# EAGLE design ring_oled_v3-1-1 (EAGLE 9.6.2)
COMPANY: ADAFRUIT INDUSTRIES; DRAWN: KTOWN; REV: F
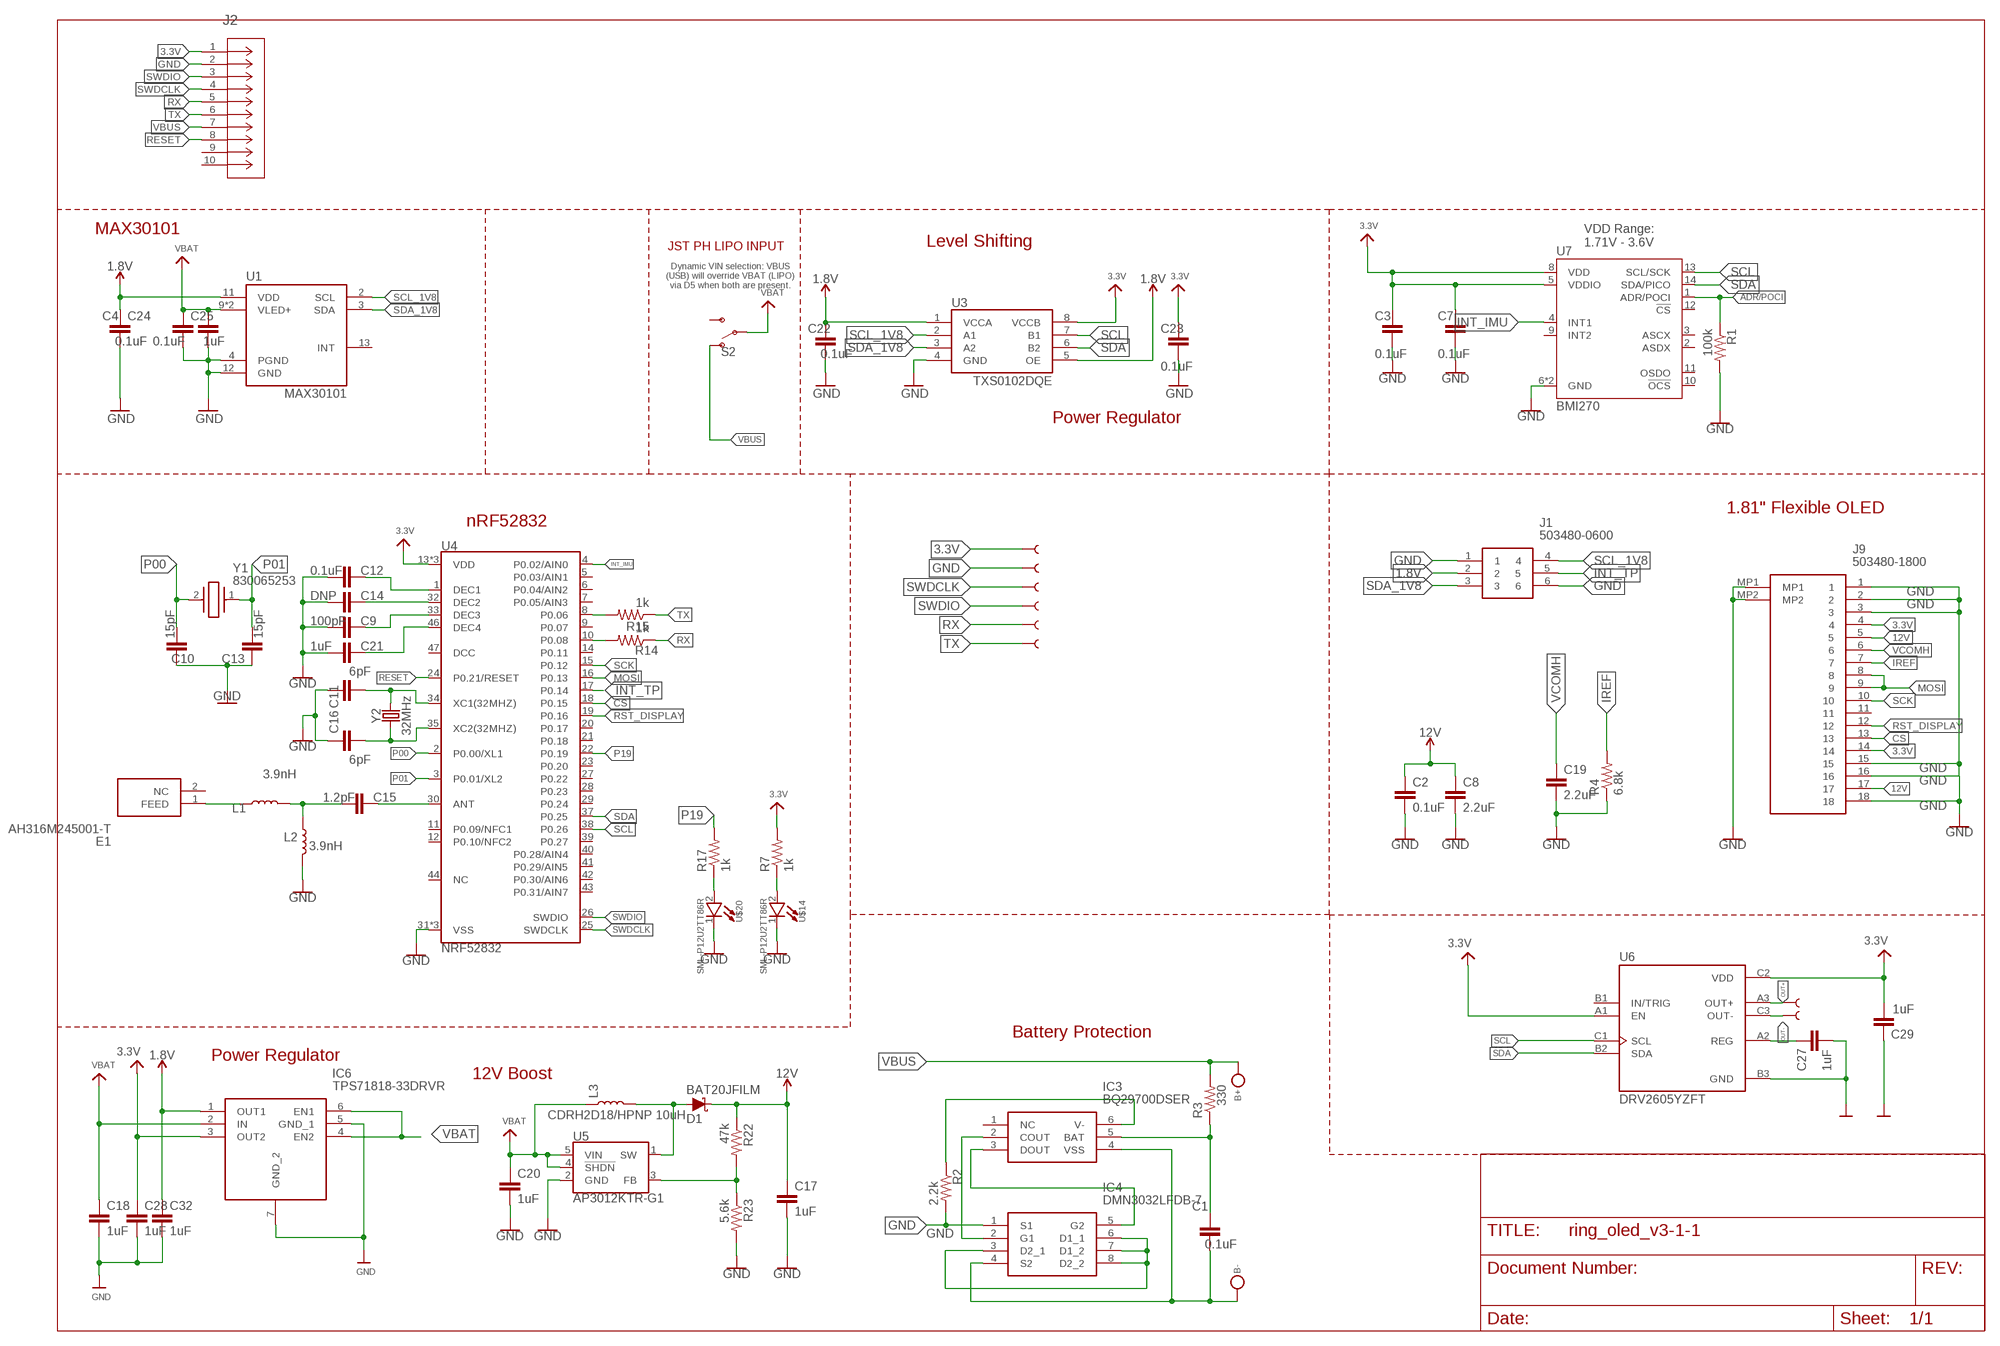
[diagram p0: schematic, sheet 1]

## Parts
B+  TESTPOINTROUND2MM  [TESTPOINT_ROUND_2MM]
B-  TESTPOINTROUND2MM  [TESTPOINT_ROUND_2MM]
C1  0.1uF  C-EUC0201  [C0201]
C2  0.1uF  SPARKFUN-CAPACITORS_1.0UF-0402-16V-10%  [SPARKFUN-CAPACITORS_0402]
C3  0.1uF  C-EUC0201  [C0201]
C4  0.1uF  C-EUC0201  [C0201]
C7  0.1uF  C-EUC0201  [C0201]
C8  2.2uF  SPARKFUN-CAPACITORS_1.0UF-0402-16V-10%  [SPARKFUN-CAPACITORS_0402]
C9  100pF  C-EUC0201  [C0201]
C10  15pF  C-EUC0201  [C0201]
C11  6pF  C-EUC0201  [C0201]
C12  0.1uF  C-EUC0201  [C0201]
C13  15pF  C-EUC0201  [C0201]
C14  DNP  C-EUC0201  [C0201]
C15  1.2pF  C-EUC0201  [C0201]
C16  6pF  C-EUC0201  [C0201]
C17  1uF  SPARKFUN-CAPACITORS_1.0UF-0402-16V-10%  [SPARKFUN-CAPACITORS_0402]
C18  1uF  C-EUC0201  [C0201]
C19  2.2uF  SPARKFUN-CAPACITORS_1.0UF-0402-16V-10%  [SPARKFUN-CAPACITORS_0402]
C20  1uF  SPARKFUN-CAPACITORS_1.0UF-0402-16V-10%  [SPARKFUN-CAPACITORS_0402]
C21  1uF  C-EUC0201  [C0201]
C22  0.1uF  C-EUC0201  [C0201]
C23  0.1uF  C-EUC0201  [C0201]
C24  0.1uF  C-EUC0201  [C0201]
C25  1uF  C-EUC0201  [C0201]
C27  1uF  C-EUC0201  [C0201]
C28  1uF  C-EUC0201  [C0201]
C29  1uF  C-EUC0201  [C0201]
C32  1uF  C-EUC0201  [C0201]
D1  BAT20JFILM  DIODE-SCHOTTKY-BAT20J  [SOD-323]
E1  AH316M245001-T  [ANTC3216X60N]
IC3  BQ29700DSER  [SON50P150X150X80-6N]
IC4  DMN3032LFDB-7  [DMP1046UFDB7]
IC6  TPS71818-33DRVR  [SON65P200X200X80-7N]
J1  503480-0600  [503480-0600]
J2  5050701022  [CONN_505070-1022_MOL]
J9  503480-1800  [5034801800]
L1  3.9nH  NRF52832-BREAKOUT-TEMP_INDUCTOR-0402-3.9NH  [CAPC1005X55N]
L2  3.9nH  NRF52832-BREAKOUT-TEMP_INDUCTOR-0402-3.9NH  [CAPC1005X55N]
L3  CDRH2D18/HPNP 10uH  INDUCTOR-CDRH-10UH  [INDUCTOR_4.7UH]
R1  100k  R-US_R0201  [R0201]
R2  2.2k  R-US_R0201  [R0201]
R3  330  R-US_R0201  [R0201]
R4  6.8k  R-US_R0201  [R0201]
R7  1k  R-US_R0201  [R0201]
R14  1k  R-US_R0201  [R0201]
R15  1k  R-US_R0201  [R0201]
R17  1k  R-US_R0201  [R0201]
R22  47k  SPARKFUN-RESISTORS_47KOHM-0603-1/10W-1%  [SPARKFUN-RESISTORS_0603]
R23  5.6k  SPARKFUN-RESISTORS_5.6KOHM-0603-1/10W-1%  [SPARKFUN-RESISTORS_0603]
S2  SWITCH-SPDT-SMD-RIGHT-ANGLE  [SWITCH_SPST_SMD_A]
U1  MAX30101  AS-ITM-00473  [MAX30100]
U3  TXS0102DQE  AS-ITM-00073  [DQE(R-PX2SON-N8)]
U4  NRF52832  [QFN48-6X6MM]
U5  AP3012KTR-G1  AP3012  [SOT23-5]
U6  DRV2605YZFT  DRV2604YZFT  [IC_DRV2604YZFT]
U7  BMI270  [BMI270]
U$14  SML-P12U2TT86R  [DIODFN100X60X43-2N]
U$20  SML-P12U2TT86R  [DIODFN100X60X43-2N]
VBUS1  TEST-POINT3  [PAD.03X.03]
VBUS2  TEST-POINT3  [PAD.03X.03]
VBUS3  TEST-POINT3  [PAD.03X.03]
VBUS4  TEST-POINT3  [PAD.03X.03]
VBUS5  TEST-POINT3  [PAD.03X.03]
VBUS6  TEST-POINT3  [PAD.03X.03]
VBUS7  TEST-POINT3  [PAD.03X.03]
VBUS8  TEST-POINT3  [PAD.03X.03]
Y1  830065253  [830065253]
Y2  32MHz  CRYSTAL-32MHZ-SMD-2.0X1.6MM  [CRYSTAL-SMD-2.0X1.6MM]

## Nets
1.8V [power]: C4.1 C22.1 C32.1 IC6.1(OUT1) J1.2 U1.11(VDD) U3.1(VCCA) U3.5(OE)
3.3V [power]: C3.1 C7.1 C23.1 C28.1 C29.2 IC6.3(OUT2) J2.1 J9.4 J9.14 R7.2 U3.8(VCCB) U4.13(VDD) U4.36(VDD) U4.48(VDD) U6.A1(EN) U6.C2(VDD) U7.5(VDDIO) U7.8(VDD) VBUS1.P$1
12V: C2.1 C8.1 C17.1 D1.C J9.5 J9.17 R22.1
ADR/POCI: R1.1 U7.1(ADR/POCI)
CS: J9.13 U4.18(P0.15)
DEC1: C12.1 U4.1(DEC1)
DEC2: C14.1 U4.32(DEC2)
DEC3: C9.1 U4.33(DEC3)
DEC4: C21.1 U4.46(DEC4)
GND: C2.2 C3.2 C4.2 C7.2 C8.2 C9.2 C10.1 C11.1 C12.2 C13.1 C14.2 C16.1 C17.2 C18.2 C19.2 C20.2 C21.2 C22.2 C23.2 C24.2 C25.2 C27.2 C28.2 C29.1 C32.2 IC4.1(S1) IC6.5(GND_1) IC6.7(GND_2) J1.1 J1.6 J2.2 J9.1 J9.2 J9.3 J9.15 J9.16 J9.18 J9.MP1 J9.MP2 L2.2 R1.2 R2.2 R4.1 R23.2 U1.4(PGND) U1.12(GND) U3.4(GND) U4.31(VSS) U4.45(VSS) U4.EP(VSS) U5.2(GND) U6.B3(GND) U7.6(GND) U7.7(GND) U$14.1(C) U$20.1(C) VBUS2.P$1
INT_IMU: U4.4(P0.02/AIN0) U7.4(INT1)
INT_TP: J1.5 U4.17(P0.14)
IREF: J9.7 R4.2
MOSI: J9.8 J9.9 U4.16(P0.13)
N$1: IC4.3(D2_1) IC4.6(D1_1) IC4.7(D1_2) IC4.8(D2_2)
N$2: IC3.2(COUT) IC4.2(G1)
N$3: IC3.3(DOUT) IC4.5(G2)
N$4: C15.2 L1.2 L2.1
N$5: IC3.6(V-) R2.1
N$6: R7.1 U$14.2(A)
N$7: B-.P$1 C1.2 IC3.4(VSS) IC4.4(S2)
N$8: E1.1(FEED) L1.1
N$9: C15.1 U4.30(ANT)
N$10: C1.1 IC3.5(BAT) R3.1
N$12: R15.2 U4.8(P0.06)
N$13: R14.2 U4.10(P0.08)
N$16: D1.A L3.P$2 U5.1(SW)
N$17: R22.2 R23.1 U5.3(FB)
N$19: C27.1 U6.A2(REG)
N$20: R17.1 U$20.2(A)
OUT+: U6.A3(OUT+) VBUS3.P$1
OUT-: U6.C3(OUT-) VBUS4.P$1
P00: C10.2 U4.2(P0.00/XL1) Y1.2(CRYSTAL_2)
P01: C13.2 U4.3(P0.01/XL2) Y1.1(CRYSTAL_1)
P19: R17.2 U4.22(P0.19)
RESET: J2.8 U4.24(P0.21/RESET)
RST_DISPLAY: J9.12 U4.19(P0.16)
RX: J2.5 R14.1 VBUS7.P$1
SCK: J9.10 U4.15(P0.12)
SCL: U3.7(B1) U4.38(P0.26) U6.C1(SCL) U7.13(SCL/SCK)
SCL_1V8: J1.4 U1.2(SCL) U3.2(A1)
SDA: U3.6(B2) U4.37(P0.25) U6.B2(SDA) U7.14(SDA/PICO)
SDA_1V8: J1.3 U1.3(SDA) U3.3(A2)
SWDCLK: J2.4 U4.25(SWDCLK) VBUS5.P$1
SWDIO: J2.3 U4.26(SWDIO) VBUS6.P$1
TX: J2.6 R15.1 VBUS8.P$1
VBAT [power]: C18.1 C20.1 C24.1 C25.1 IC6.2(IN) IC6.4(EN2) IC6.6(EN1) L3.P$1 S2.2(P) U1.9(VLED+) U1.10(VLED+) U5.4(!SHDN!) U5.5(VIN)
VBUS: B+.P$1 J2.7 R3.2 S2.1(O)
VCOMH: C19.1 J9.6
XC1: C11.2 U4.34(XC1(32MHZ)) Y2.3
XC2: C16.2 U4.35(XC2(32MHZ)) Y2.1
Unconnected: E1.2(NC) IC3.1(NC) J2.9 J2.10 J9.11 S2.3(S) U1.13(INT) U4.5(P0.03/AIN1) U4.6(P0.04/AIN2) U4.7(P0.05/AIN3) U4.9(P0.07) U4.11(P0.09/NFC1) U4.12(P0.10/NFC2) U4.14(P0.11) U4.20(P0.17) U4.21(P0.18) U4.23(P0.20) U4.27(P0.22) U4.28(P0.23) U4.29(P0.24) U4.39(P0.27) U4.40(P0.28/AIN4) U4.41(P0.29/AIN5) U4.42(P0.30/AIN6) U4.43(P0.31/AIN7) U4.44(NC) U4.47(DCC) U6.B1(IN/TRIG) U7.2(ASDX) U7.3(ASCX) U7.9(INT2) U7.10(!OCS!) U7.11(OSDO) U7.12(!CS!)

## Notes on the sheet
- MAX30101
- VDD Range:
  1.71V - 3.6V
- Level Shifting
- JST PH LIPO INPUT
- Dynamic VIN selection: VBUS
  (USB) will override VBAT (LIPO)
  via D5 when both are present.
- Power Regulator
- 1.81" Flexible OLED
- nRF52832
- Battery Protection
- Power Regulator
- 12V Boost

## Library data of the parts
B+ B- = microbuilder:TESTPOINT: Test Point Various test points for characterisation and PCB testing TESTPOINT_SMT - Compact Surface Mount Test Point [Digikey: 5016KTR-ND]
C1 C3 C4 C7 C9-C16 C18 C21-C25 C27-C29 C32 = rcl:C-EU: CAPACITOR, European symbol; SPICEPREFIX: C
C2 C8 C17 C19 C20 = ring_oled_v1:SPARKFUN-CAPACITORS_1.0UF: 1µF ceramic capacitors A capacitor is a passive two-terminal electrical component used to store electrical energy temporarily in an electric field.; PROD_ID: CAP-12417; VALUE: 1.0uF
D1 = SparkFun-DiscreteSemi:DIODE-SCHOTTKY: Schottky diode A Schottky diode is a semiconductor diode which has a low forward voltage drop and a very fast switching action.; PROD_ID: DIO-11623; VALUE: 1A/23V/620mV
E1 = SamacSys_Parts:AH316M245001-T: Antennas SURF MOUNT ANTENNA RADIEDGE Source: Datasheet; DESCRIPTION: Antennas SURF MOUNT ANTENNA RADIEDGE; HEIGHT: 0.6mm; MANUFACTURER_NAME: TAIYO YUDEN; MANUFACTURER_PART_NUMBER: AH316M245001-T; MOUSER_PART_NUMBER: 963-AH316M245001-T; MOUSER_PRICE-STOCK: https://www.mouser.co.uk/ProductDetail/TAIYO-YUDEN/AH316M245001-T?qs=I6KAKw0tg2zXv3bNBw9dFQ%3D%3D
IC3 = SamacSys_Parts:BQ29700DSER: Li-Ion/Li Polymer Advanced Single-Cell Battery Protector IC Family Source: Datasheet <http://www.ti.com/lit/ds/symlink/bq2971.pdf>; DESCRIPTION: Li-Ion/Li Polymer Advanced Single-Cell Battery Protector IC Family; HEIGHT: 0.8mm; MANUFACTURER_NAME: Texas Instruments; MANUFACTURER_PART_NUMBER: BQ29700DSER; MOUSER_PART_NUMBER: 595-BQ29700DSER; MOUSER_PRICE-STOCK: https://www.mouser.co.uk/ProductDetail/Texas-Instruments/BQ29700DSER?qs=%2Fd%252BFzHvH4c3zNh7Hkm%2Fvbw%3D%3D
IC4 = SamacSys_Parts:DMN3032LFDB-7: MOSFET MOSFET BVDSS Source: Datasheet <https://www.diodes.com/assets/Datasheets/DMN3032LFDB.pdf>; DESCRIPTION: MOSFET MOSFET BVDSS; HEIGHT: 0.605mm; MANUFACTURER_NAME: Diodes Incorporated; MANUFACTURER_PART_NUMBER: DMN3032LFDB-7; MOUSER_PART_NUMBER: 621-DMN3032LFDB-7; MOUSER_PRICE-STOCK: https://www.mouser.co.uk/ProductDetail/Diodes-Incorporated/DMN3032LFDB-7?qs=60RJRzIpcl%2FACqnWGZWGig%3D%3D
IC6 = SamacSys_Parts:TPS71818-33DRVR: Dual 200mA Output, Low Noise, High PSRR, Low Dropout, Linear Regulator Source: Datasheet <http://www.ti.com/lit/gpn/TPS718>; ARROW_PART_NUMBER: TPS71818-33DRVR; ARROW_PRICE-STOCK: https://www.arrow.com/en/products/tps71818-33drvr/texas-instruments; DESCRIPTION: Dual 200mA Output, Low Noise, High PSRR, Low Dropout, Linear Regulator; HEIGHT: 0.8mm; MANUFACTURER_NAME: Texas Instruments; MANUFACTURER_PART_NUMBER: TPS71818-33DRVR
J1 = 503480-0600:503480-0600: Easy-On BackFlip 0.5mm FPC Connector, 6P Molex 503480 Series 0.5mm Pitch 6 Way Right Angle SMT Male FPC Connector, Solder Source: Datasheet <http://www.molex.com/webdocs/datasheets/pdf/en-us/5034800600_FFC_FPC_CONNECTORS.pdf>; DESCRIPTION: Easy-On BackFlip 0.5mm FPC Connector, 6P Molex 503480 Series 0.5mm Pitch 6 Way Right Angle SMT Male FPC Connector, Solder; HEIGHT: mm; MANUFACTURER_NAME: Molex; MANUFACTURER_PART_NUMBER: 503480-0600; MOUSER_PART_NUMBER: 538-503480-0600; MOUSER_PRICE-STOCK: https://www.mouser.co.uk/ProductDetail/Molex/503480-0600?qs=bodV9ulq6Gw510ukaFX%252Bew%3D%3D
J2 = 5050700822_cap:5050701022; COPYRIGHT: Copyright (C) 2024 Ultra Librarian. All rights reserved.; MANUFACTURER_PART_NUMBER: 5050701022; MFR_NAME: Molex Connector Corporation
J9 = 503480-1800:503480-1800: Molex 503480 Series 0.5mm Pitch 18 Way SMT Female FPC Connector Source: Datasheet <https://www.molex.com/pdm_docs/sd/5034801800_sd.pdf>; DESCRIPTION: Molex 503480 Series 0.5mm Pitch 18 Way SMT Female FPC Connector; HEIGHT: 1.87mm; MANUFACTURER_NAME: Molex; MANUFACTURER_PART_NUMBER: 503480-1800; MOUSER_PART_NUMBER: 538-503480-1800; MOUSER_PRICE-STOCK: https://www.mouser.co.uk/ProductDetail/Molex/503480-1800?qs=6kT3pPPHxnV1JeObKwf9bQ%3D%3D
L1 L2 = ring_v6-1-2:NRF52832-BREAKOUT-TEMP_INDUCTOR: Inductors Resist changes in electrical current. Basically a coil of wire. SparkFun Products: SparkFun Load Cell Amplifier - HX711 <https://www.sparkfun.com/products/13879> IOIO-OTG - V2.2 <https://www.sparkfun.com/products/13613>; PROD_ID: NDUC-13457
L3 = SparkFun-Coils:INDUCTOR: Inductors Resist changes in electrical current. Basically a coil of wire. SparkFun Products: SparkFun Load Cell Amplifier - HX711 <https://www.sparkfun.com/products/13879> IOIO-OTG - V2.2 <https://www.sparkfun.com/products/13613>; PROD_ID: NDUC-13968; VALUE: 10uH
R1-R4 R7 R14 R15 R17 = rcl:R-US_: RESISTOR, American symbol; SPICEPREFIX: R
R22 = ring_oled_v1:SPARKFUN-RESISTORS_47KOHM: 47kΩ resistor A resistor is a passive two-terminal electrical component that implements electrical resistance as a circuit element. Resistors act to reduce current flow, and, at the same time, act to lower voltage levels within circuits. - Wikipedia; PROD_ID: RES-07871
R23 = ring_oled_v1:SPARKFUN-RESISTORS_5.6KOHM: 5.6kΩ resistor A resistor is a passive two-terminal electrical component that implements electrical resistance as a circuit element. Resistors act to reduce current flow, and, at the same time, act to lower voltage levels within circuits. - Wikipedia; PROD_ID: RES-12378
S2 = SparkFun-Switches:SWITCH-SPDT: Single Pole, Double Throw (SPDT) Switch Single-pole, double-throw (SPDT) switch. Variant Overview SMD-AYZ0202 Surface Mount DPDT Switch <https://www.sparkfun.com/products/597> (COM-00597) Used on e.g. LilyPad Arduino USB - ATmega32U4 Board <https://www.sparkfun.com/products/12049> PTH-11.6X4.0MM SPDT Mini Power Switch <https://www.sparkfun.com/products/102> (COM-00102) Used on e.g. SparkFun Simon Says - Through-Hole Soldering Kit <https://www.sparkfun.com/products/10547> (KIT-10547) PTH-11.6X4.0MM-KIT KIT version of SPDT Mini Power Switch - Simplifies soldering by removing tStop of switch pins - only one side can be soldered. PTH-11.6X4.0MM-LOCK LOCK version of SPDT Mini Power Switch - Offset pins hold switch in place for easier soldering. SMD-RIGHT-ANGLE Surface Mount Right Angle Switch <https://www.sparkfun.com/products/10860> (COM-10860) Used on e.g. SparkFun ESP8266 Thing <https://www.sparkfun.com/products/13231>; PROD_ID: SWCH-10651; SF_SKU: COM-10860
U1 = tinycircuits:AS-ITM-00473: INTEGRATED OPTICAL SENSOR; PARTNO: AS-ITM-00473
U3 = tinycircuits:AS-ITM-00073: TI 2-Bit Bidirectional Voltage-Level Translator; PARTNO: AS-ITM-00073; PNPROTATION: 0; VALUE: TXS0102
U4 = nrf52832-breakout-temp:NRF52832: Nordic nRF52832 Bluetooth Smart/ANT/2.4GHz RF SoC The nRF52832 SoC is a powerful, highly flexible ultra-low power multiprotocol SoC ideally suited for Bluetooth® Smart ANT and 2.4GHz ultra low-power wireless applications. The nRF52832 SoC is built around a 32-bit ARM® Cortex™-M4F CPU with 512kB + 64kB RAM. The embedded 2.4GHz transceiver supports Bluetooth Smart, ANT and proprietary 2.4 GHz protocol stack. It is on air compatible with the nRF51 Series, nRF24L and nRF24AP Series products from Nordic Semiconductor. Product Page <https://www.nordicsemi.com/eng/Products/Bluetooth-low-energy2/nRF52832>; PROD_ID: IC-13460
U5 = SparkFun-IC-Power:AP3012: AP3012 The AP3012 is a high power, constant frequency, current mode PWM, inductor based, step-up (boost) converter. The converter operates at high frequency (1.5MHz) so that a small, low profile inductor can be used. Datasheet <https://www.diodes.com/assets/Datasheets/AP3012.pdf>; PROD_ID: VREG-13911; VALUE: AP3012
U6 = DRV2604YZFT:DRV2604YZFT: Check availability <https://pricing.snapeda.com/parts/DRV2604YZFT/Texas%20Instruments/view-part?ref=eda>; AVAILABILITY: In Stock; CHECK_PRICES: https://www.snapeda.com/parts/DRV2604YZFT/Texas+Instruments/view-part/?ref=eda; DESCRIPTION: Haptic driver for ERM/LRA with waveform memory & auto-resonance tracking; MF: Texas Instruments; MP: DRV2604YZFT; PACKAGE: DSBGA-9 Texas Instruments; PRICE: None; SNAPEDA_LINK: https://www.snapeda.com/parts/DRV2604YZFT/Texas+Instruments/view-part/?ref=snap
U7 = BMI270:BMI270; PROD_ID: IC-15423
U$14 U$20 = SML-D12U1WT86:SML-P12U2TT86R
VBUS1-VBUS8 = SparkFun-Connectors:TEST-POINT: SparkFun Test Points Bare copper test points for troubleshooting or In-Circuit-Testing. These are used by our Production team for verifying production board runs using pogo-pins on test beds. SparkFun Products: SparkFun LSM9DS1 Breakout <https://www.sparkfun.com/products/13284> SparkFun PSOC <https://www.sparkfun.com/products/13714> SparkFun Load Cell Amplifier <https://www.sparkfun.com/products/13879>
Y1 = 830065253:830065253: 1.6 x 1.0mm SMD crystal in a hermetically sealed ceramic package. Source: Datasheet <https://www.we-online.com/catalog/datasheet/830065253.pdf>; DESCRIPTION: 1.6 x 1.0mm SMD crystal in a hermetically sealed ceramic package.; HEIGHT: 0.5mm; MANUFACTURER_NAME: Wurth Elektronik; MANUFACTURER_PART_NUMBER: 830065253; MOUSER_PART_NUMBER: 710-830065253; MOUSER_PRICE-STOCK: https://www.mouser.co.uk/ProductDetail/Wurth-Elektronik/830065253?qs=2WXlatMagcE5o8krQdIeDA%3D%3D
Y2 = nrf52832-breakout-temp:CRYSTAL-32MHZ: 32MHz Crystal Digikey Example <http://www.digikey.com/product-detail/en/murata-electronics-north-america/XRCGB32M000F2P00R0/490-9769-1-ND/4952013> Frequency: 32MHz Frequency Stability: ±20ppm Frequency Tolerance: ±20ppm Load Capacitance: 6pF; PROD_ID: XTAL-13459

## Net classes
1 power: width 0.127 mm

## Board
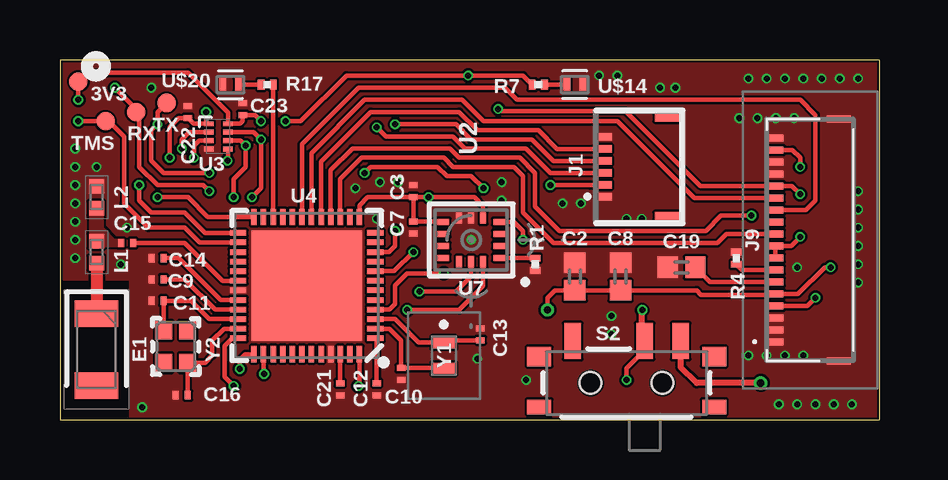
[diagram p1: board, top side]
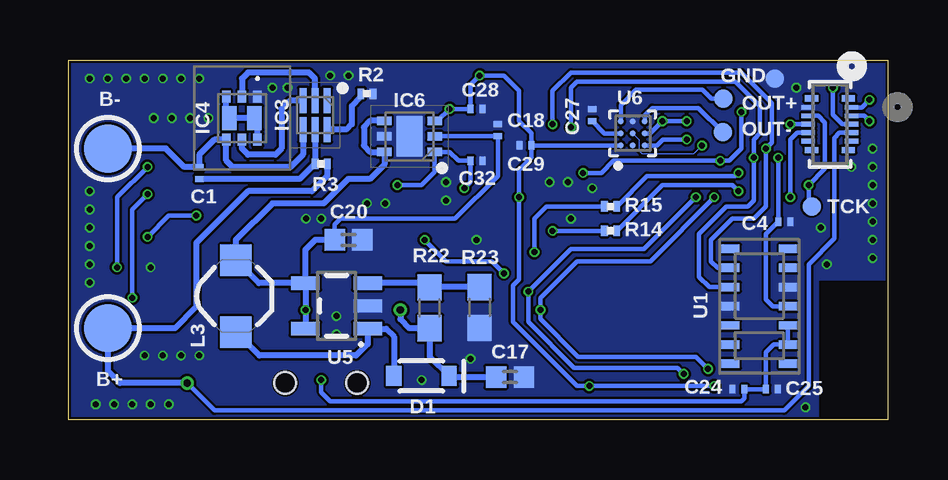
[diagram p2: board, bottom side, seen from below]

Size 34.16 x 15 mm. Coordinates in mm from the lower left corner, seen from the top.
Outline: 34.16,15 0,15 0,0 34.16,0 34.16,15
Copper layers (1*16): Top 0.035mm / dielectric 0.23mm / Bottom 0.035mm
Design rules "jlcpcb-2layers_v2 *": minimum track width 0.05mm, minimum drill 0.1mm, track to track 0.05mm, track to pad 0.05mm, pad to pad 0.05mm, via to via 0.05mm, smd to smd 0.05mm, copper to edge 0.05mm, drill to drill 0.05mm, minimum pad ring 10mil, minimum via ring 3mil, stop-mask expansion 4mil, vias tented up to drill 20mil, thermal gap 10mil

### Footprints (pad centres in the part's own frame; a part is rotated, then mirrored left to right if it is on the bottom)
TESTPOINT_ROUND_2MM = smd 2 x 2: P$1 0,0
C0201 = smd 0.25 x 0.35: 1 -0.25,0; 2 0.25,0
SPARKFUN-CAPACITORS_0402 = smd 0.85 x 0.9: 1 -0.58,0; 2 0.58,0
SOD-323 = smd 0.63 x 0.83: A 1.15,0; C -1.15,0
ANTC3216X60N = smd 1.1 x 1.8: 1 -1.5,0; 2 1.5,0
SON50P150X150X80-6N = smd 1.05 x 0.3: 1 -0.6,0.5; 2 -0.6,0; 3 -0.6,-0.5; 4 0.6,-0.5; 5 0.6,0; 6 0.6,0.5
DMP1046UFDB7 = smd 0.35 x 0.5: 1 -0.65,-0.9; 2 0,-0.9; 3 0.65,-0.9; 4 0.65,0.9; 5 0,0.9; 6 -0.65,0.9 | smd 0.6 x 1: 7 -0.525,0; 8 0.525,0
SON65P200X200X80-7N = smd 0.6 x 0.35: 1 -1.05,0.65; 2 -1.05,0; 3 -1.05,-0.65; 4 1.05,-0.65; 5 1.05,0; 6 1.05,0.65 | smd 1.1 x 1.7: 7 0,0
503480-0600 = smd 0.3 x 0.7: 1 -1.25,-0.3; 2 -0.75,-0.3; 3 -0.25,-0.3; 4 0.25,-0.3; 5 0.75,-0.3; 6 1.25,-0.3 | smd 0.3 x 1: 7 -2.04,-2.95; 8 2.04,-2.95
CONN_505070-1022_MOL = smd 0.203 x 0.559: 1 -0.7,0.907; 2 -0.7,-0.907; 3 -0.35,0.907; 4 -0.35,-0.907; 5 0,0.907; 6 0,-0.907; 7 0.35,0.907; 8 0.35,-0.907; 9 0.7,0.907; 10 0.7,-0.907 | smd 0.254 x 0.559: 11 -1.075,0.767; 12 1.075,0.767; 13 -1.075,-0.767; 14 1.075,-0.767
5034801800 = smd 0.3 x 0.7: 1 -4.25,-0.35; 2 -3.75,-0.35; 3 -3.25,-0.35; 4 -2.75,-0.35; 5 -2.25,-0.35; 6 -1.75,-0.35; 7 -1.25,-0.35; 8 -0.75,-0.35; 9 -0.25,-0.35; 10 0.25,-0.35; 11 0.75,-0.35; 12 1.25,-0.35; 13 1.75,-0.35; 14 2.25,-0.35; 15 2.75,-0.35; 16 3.25,-0.35; 17 3.75,-0.35; 18 4.25,-0.35 | smd 0.3 x 1: MP1 -5.04,-3; MP2 5.04,-3
CAPC1005X55N = smd 0.6 x 0.62: 1 -0.46,0; 2 0.46,0
INDUCTOR_4.7UH = smd 1.3 x 1.3: P$1 -1.5,0; P$2 1.5,0
R0201 = smd 0.28 x 0.43: 1 -0.255,0; 2 0.255,0
SPARKFUN-RESISTORS_0603 = smd 1.1 x 1: 1 -0.85,0; 2 0.85,0
SWITCH_SPST_SMD_A = smd 0.7 x 1.5: 1 -2.25,-1.75; 2 -0.75,-1.75; 3 2.25,-1.75 | smd 1 x 0.6: GND1 -3.65,1; GND3 3.65,1 | smd 1 x 0.8: GND2 -3.65,-1.1; GND4 3.65,-1.1 | hole 0.9: -1.5,0; 1.5,0
MAX30100 = smd 0.75 x 0.35: 1 -1.2,2.4; 2 -1.2,1.6; 3 -1.2,0.8; 4 -1.2,0; 5 -1.2,-0.8; 6 -1.2,-1.6; 7 -1.2,-2.4; 8 1.2,-2.4; 9 1.2,-1.6; 10 1.2,-0.8; 11 1.2,0; 12 1.2,0.8; 13 1.2,1.6; 14 1.2,2.4
DQE(R-PX2SON-N8) = smd 0.2 x 0.4: 1 -0.525,-0.4; 2 -0.175,-0.4; 3 0.175,-0.4; 4 0.525,-0.4; 5 0.525,0.4; 6 0.175,0.4; 7 -0.175,0.4; 8 -0.525,0.4
QFN48-6X6MM = smd 0.68 x 0.23: 1 -2.86,2.2; 2 -2.86,1.8; 3 -2.86,1.4; 4 -2.86,1; 5 -2.86,0.6; 6 -2.86,0.2; 7 -2.86,-0.2; 8 -2.86,-0.6; 9 -2.86,-1; 10 -2.86,-1.4; 11 -2.86,-1.8; 12 -2.86,-2.2; 25 2.86,-2.2; 26 2.86,-1.8; 27 2.86,-1.4; 28 2.86,-1; 29 2.86,-0.6; 30 2.86,-0.2; 31 2.86,0.2; 32 2.86,0.6; 33 2.86,1; 34 2.86,1.4; 35 2.86,1.8; 36 2.86,2.2 | smd 0.23 x 0.68: 13 -2.2,-2.86; 14 -1.8,-2.86; 15 -1.4,-2.86; 16 -1,-2.86; 17 -0.6,-2.86; 18 -0.2,-2.86; 19 0.2,-2.86; 20 0.6,-2.86; 21 1,-2.86; 22 1.4,-2.86; 23 1.8,-2.86; 24 2.2,-2.86; 37 2.2,2.86; 38 1.8,2.86; 39 1.4,2.86; 40 1,2.86; 41 0.6,2.86; 42 0.2,2.86; 43 -0.2,2.86; 44 -0.6,2.86; 45 -1,2.86; 46 -1.4,2.86; 47 -1.8,2.86; 48 -2.2,2.86 | smd 4.6 x 4.6: EP 0,0
SOT23-5 = smd 0.55 x 1.2: 1 -0.95,-1.3; 2 0,-1.3; 3 0.95,-1.3; 4 0.95,1.3; 5 -0.95,1.3
IC_DRV2604YZFT = smd 0.245 x 0.245: A1 -0.5,0.5; A2 0,0.5; A3 0.5,0.5; B1 -0.5,0; B2 0,0; B3 0.5,0; C1 -0.5,-0.5; C2 0,-0.5; C3 0.5,-0.5
BMI270 = smd 0.475 x 0.25: 1 -1.163,0.75; 2 -1.163,0.25; 3 -1.163,-0.25; 4 -1.163,-0.75; 8 1.163,-0.75; 9 1.163,-0.25; 10 1.163,0.25; 11 1.163,0.75 | smd 0.25 x 0.475: 5 -0.5,-0.912; 6 0,-0.912; 7 0.5,-0.912; 12 0.5,0.912; 13 0,0.912; 14 -0.5,0.912
DIODFN100X60X43-2N = smd 0.28 x 0.52: 1 -0.325,0; 2 0.325,0
PAD.03X.03 = smd 0.762 x 0.762: P$1 0,0
830065253 = smd 0.5 x 1: 1 -0.55,0; 2 0.55,0
CRYSTAL-SMD-2.0X1.6MM = smd 0.75 x 0.7: 1 -0.675,-0.5; 2 0.675,-0.5; 3 0.675,0.5; 4 -0.675,0.5

### Placement (x,y rotation side)
B+  32.51,3.81 0 bottom
B-  32.51,11.3 0 bottom
C1  28.7,10.29 90 bottom
C2  21.46,5.97 90 top
C3  14.73,9.53 90 top
C4  4.32,8.26 0 bottom
C7  14.73,8 270 top
C8  23.37,5.97 90 top
C9  4.06,5.84 180 top
C10  14.22,1.91 90 top
C11  4.06,4.95 0 top
C12  13.21,1.27 270 top
C13  17.53,3.56 270 top
C14  4.06,6.73 180 top
C15  2.79,7.37 180 top
C16  5.08,1.02 0 top
C17  15.75,1.78 0 bottom
C18  16.26,12.06 90 bottom
C19  25.91,6.35 180 top
C20  22.48,7.49 0 bottom
C21  11.68,1.27 270 top
C22  5.33,12.83 90 top
C23  7.62,12.95 90 top
C24  6.22,1.27 180 bottom
C25  4.83,1.27 0 bottom
C27  12.32,12.7 90 bottom
C28  17.14,12.95 0 bottom
C29  15.11,11.43 0 bottom
C32  17.14,10.79 0 bottom
D1  19.44,1.81 180 bottom
E1  1.52,2.92 270 top
IC3  23.88,12.7 270 bottom
IC4  26.92,12.57 180 bottom
IC6  19.94,11.81 180 bottom
J1  22.35,10.54 90 top
J2  2.41,12.32 270 bottom
J9  29.46,7.49 90 top
L1  1.52,6.99 90 top
L2  1.52,9.27 90 top
L3  27.18,5.15 270 bottom
R1  19.81,6.48 270 top
R2  21.72,13.59 0 bottom
R3  23.62,10.67 0 bottom
R4  28.19,6.73 270 top
R7  19.94,13.97 180 top
R14  11.56,7.87 180 bottom
R15  11.56,8.89 180 bottom
R17  8.64,13.97 0 top
R22  19.1,4.66 90 bottom
R23  17.02,4.67 270 bottom
S2  23.62,1.52 180 top
U1  5.36,4.73 0 bottom
U3  6.6,11.81 270 top
U4  10.29,5.59 180 top
U5  22.98,4.74 90 bottom
U6  10.63,11.93 90 bottom
U7  17.14,7.49 180 top
U$14  21.46,13.97 180 top
U$20  7.11,13.97 0 top
VBUS1  0.76,14.1 0 top
VBUS2  4.7,14.22 0 bottom
VBUS3  6.85,13.38 90 bottom
VBUS4  6.87,11.98 90 bottom
VBUS5  3.17,8.89 0 bottom
VBUS6  1.91,12.45 0 top
VBUS7  3.17,12.83 0 top
VBUS8  4.45,13.21 0 top
Y1  16,2.67 270 top
Y2  4.83,3.05 90 top

### Tracks (layer width: path | path; a pad name or v marks a point on that pad's centre or on a via)
1.8V  (via drill 0.25)
  Top 0.178: J1.2 22.11,9.79 22.1,9.78 v20.45,9.78 | C22.1 | C22.1 5.57,12.34 U3.1 6.1,12.34 v6.1,12.83 | U3.5 7,10.81 v6.99,10.79 | v17.65,9.65 17.14,10.16 16.13,10.16 15.75,10.54 12.95,10.54 v12.7,10.29 | v4.57,10.92 4.57,12.19 4.95,12.57 C22.1
  Bottom 0.178: v20.45,9.78 19.43,9.78 18.89,10.32 IC6.1 18.27,11.16 17.9,10.79 C32.1 17.39,9.91 v17.65,9.65 | v6.1,12.83 6.1,11.3 6.6,10.79 v6.99,10.79 11.43,10.79 11.94,10.29 v12.7,10.29 | v4.57,10.92 C4.1 5.08,7.74 5.08,5.01 4.79,4.73 U1.11
3.3V  (via drill 0.25)
  Top 0.178: U7.8 C7.1 C3.1 | J9.4 31.16,4.74 v31.5,5.08 | v30.86,9.4 30.52,9.74 J9.14 26.71,9.74 23.58,12.87 18.35,12.87 v18.27,12.95 | R7.2 19.3,14.35 v17.02,14.35 11.94,14.35 10.03,12.45 v9.4,12.45 | v8.38,12.45 8.13,12.7 C23.1 7.62,12.45 7.51,12.34 U3.8 7,12.81 5.33,14.48 1.14,14.48 VBUS1.P$1 v0.76,13.34 | C3.1 v15.37,9.27 17.27,9.27 17.64,8.9 U7.5 | U4.48 12.49,1.44 v12.45,1.4 | v7.24,1.4 6.86,1.78 6.86,3.07 7.17,3.39 U4.36 | U4.13 12.49,8.93 12.83,9.28 C3.1
  Bottom 0.178: IC6.3 18.76,12.46 v18.27,12.95 C28.1 17.39,13.97 v17.02,14.35 16,14.35 15.37,13.72 15.37,12.45 14.86,11.94 C29.2 | v30.86,9.4 31.5,8.76 v31.5,5.08 | U6.C2 9.91,11.93 v9.4,12.45 v8.38,12.45 | v0.76,13.34 1.08,13.02 J2.1 | v7.24,1.4 v12.45,1.4 12.95,1.4 15.62,4.06 15.62,5.59 15.37,5.84 v15.37,9.27 15.37,10.41 14.86,10.92 C29.2 | U6.A1 12.7,11.43 C29.2
12V  (via drill 0.25, 0.3 pad 0.55)
  Top 0.178: v20.32,4.57 20.32,5.08 20.63,5.39 C2.1 C8.1 26.54,5.39 26.73,5.21 29.78,5.21 J9.5 30.77,5.24 31.88,6.35 v32.13,6.35 | J9.17 30.54,11.24 30.86,10.92 v30.86,10.54
  Bottom 0.178: v30.86,10.54 32.13,9.27 v32.13,6.35
  Bottom 0.254: C17.1 18.26,1.78 D1.C 19.1,2.62 R22.1 19.94,3.81 20.32,4.19 v20.32,4.57
ADR/POCI
  Top 0.178: U7.1 19.8,6.74 R1.1
CS
  Top 0.178: U4.18 10.49,11.12 12.7,13.34 16.76,13.34 17.65,12.45 23.24,12.45 26.44,9.24 J9.13
DEC1
  Top 0.178: U4.1 13.21,3.33 C12.1
DEC2
  Top 0.178: C14.1 4.95,6.73 6.7,4.99 U4.32
DEC3
  Top 0.178: U4.33 6.46,4.59 5.21,5.84 C9.1
DEC4
  Top 0.178: U4.46 C21.1
GND  (via drill 0.25)
  other vias: 30.73,6.35 3.81,13.84 0.64,11.3 0.64,9.78 0.64,9.02 0.64,8.26 0.64,7.49 0.64,6.73 2.79,8 2.54,6.48 0.64,10.54 29.46,14.22 30.23,14.22 30.99,14.22 31.75,14.22 32.51,14.22 33.27,14.22 25.65,13.84 28.32,12.57 29.08,12.57 29.84,12.57 30.61,12.57 25.02,13.84 28.7,14.22 33.27,5.71 33.27,6.48 33.27,7.24 33.27,8 33.27,8.76 33.27,9.53 33.02,0.64 32.26,0.64 31.5,0.64 30.73,0.64 29.97,0.64 30.99,2.67 30.23,2.67 29.46,2.67 28.7,2.67 22.48,14.35 23.24,14.35 23.62,8.38 24.26,8.38 20.95,9.02 21.72,9.02 22.99,4.32 22.99,3.56 17.14,7.49 14.1,9.91 13.34,9.91 12.32,9.65 13.21,8.38 17.4,2.54 18.41,9.14 18.41,9.91 19.43,1.65 1.52,10.54 3.43,0.51
  pour Bottom (isolate 0.102, rank 2, no thermals): 0,14.99 0,5.84 2.92,5.84 2.92,0 34.16,0 34.16,14.99
  pour Top (isolate 0.102, rank 2, no thermals): 0,14.99 0,5.84 2.92,5.84 2.92,0 34.16,0 34.16,14.99
INT_IMU  (via drill 0.25)
  Top 0.178: U7.4 18.93,8.24 19.3,7.87 v19.3,7.49 | U4.4 13.73,4.59 13.97,4.83 13.97,5.59 14.48,6.1 v16,6.1
  Bottom 0.178: v19.3,7.49 18.41,6.6 16.51,6.6 v16,6.1
INT_TP
  Top 0.178: U4.17 10.89,10.76 12.95,12.83 16.64,12.83 17.4,12.06 19.94,12.06 20.71,11.29 J1.5
IREF
  Top 0.178: R4.2 28.43,6.24 J9.7
MOSI  (via drill 0.25)
  Top 0.178: J9.8 J9.9 30.48,7.24 v30.86,7.62 | U4.16 11.29,10.4 12.19,11.3 16.26,11.3 16.64,10.92 19.18,10.92 19.81,10.29 19.81,8.89 20.83,7.87 26.92,7.87 27.56,8.51 v28.83,8.51
  Bottom 0.178: v28.83,8.51 29.97,8.51 v30.86,7.62
N$1
  Bottom 0.254: IC4.6 26.27,12.45 IC4.7 IC4.8 27.57,12.7 IC4.3
N$2
  Bottom 0.254: IC3.2 23.88,14.22 24.13,14.48 26.67,14.48 26.92,14.22 IC4.2
N$3
  Bottom 0.254: IC3.3 24.93,13.3 25.27,12.95 25.27,11.3 25.53,11.05 26.67,11.05 26.92,11.3 IC4.5
N$4
  pour Top (no thermals): 1.27,9.02 1.27,7.24 2.54,7.24 2.54,7.49 2.29,7.49 1.78,8 1.78,9.02
N$5
  Bottom 0.254: R2.1 21.97,13.46 22.35,13.08 22.35,12.32 22.57,12.1 IC3.6
N$6
  Top 0.178: R7.1 U$14.2
N$7
  Bottom 0.254: IC3.4 24.38,11.06 24.89,10.54 27.3,10.54 27.57,10.81 IC4.4 28.08,11.67 28.7,11.05 C1.2 29.33,10.54 30.1,11.3 B-.P$1
N$8
  Top 0.508: L1.1 E1.1
N$9
  Top 0.178: C15.1 5.21,7.37 6.79,5.79 U4.30
N$10
  Bottom 0.254: IC3.5 R3.1 24.51,10.03 28.45,10.03 28.45,10.04 C1.1
N$12  (via drill 0.25)
  Top 0.178: v14.73,6.99 13.94,6.19 U4.8
  Bottom 0.178: R15.2 14.22,8.89 14.73,8.38 v14.73,6.99
N$13  (via drill 0.25)
  Top 0.178: v13.97,7.87 13.97,7.24 13.72,6.99 U4.10
  Bottom 0.178: v13.97,7.87 R14.2
N$16
  Bottom 0.254: L3.P$2 26.2,2.67 22.17,2.67 21.68,3.16 U5.1 20.92,3.79 20.59,3.47 D1.A
N$17
  Bottom 0.254: R22.2 19.11,5.52 | 19.11,5.52 19.28,5.69 U5.3 | R23.1 19.11,5.52
N$19
  Bottom 0.178: U6.A2 11.8,11.93 C27.1
N$20
  Top 0.178: U$20.2 R17.1
OUT+
  Bottom 0.178: VBUS3.P$1 7.36,13.38 7.74,13.76 10.5,13.76 11.13,13.12 U6.A3
OUT-
  Bottom 0.178: VBUS4.P$1 7.89,13 9.82,13 10.13,12.69 U6.C3
P00
  Top 0.178: U4.2 13.74,3.79 14.22,3.3 C10.2 15.96,2.15 Y1.2
P01
  Top 0.178: U4.3 13.97,4.19 14.94,3.22 Y1.1 16.09,3.31 C13.2
P19
  Top 0.178: R17.2 8.89,10.1 U4.22
RESET  (via drill 0.25)
  Top 0.178: v4.06,9.27 5.33,9.27 6.16,8.45 U4.24
  Bottom 0.178: J2.8 3.78,11.97 4.06,11.68 v4.06,9.27
RST_DISPLAY
  Top 0.178: U4.19 10.09,11.48 12.45,13.84 18.54,13.84 19.05,13.34 30.86,13.34 31.5,12.7 31.5,9.14 31.09,8.74 J9.12
RX  (via drill 0.25)
  Top 0.178: v6.22,9.53 5.97,9.78 4.06,9.78 3.3,10.54 3.3,12.7 VBUS7.P$1 3.17,12.95 v2.29,13.84
  Bottom 0.178: R14.1 9.4,9.78 6.48,9.78 v6.22,9.53 | v2.29,13.84 2.29,12.72 1.89,12.32 J2.5
SCK
  Top 0.178: U4.15 11.69,10.04 12.57,10.92 16,10.92 16.38,10.54 18.92,10.54 19.3,10.16 19.3,8.64 20.58,7.36 27.4,7.36 27.78,7.74 J9.10
SCL  (via drill 0.25)
  Top 0.178: U4.38 8.49,1.93 v8.51,1.91 | U7.13 17.14,5.97 16.51,5.33 v14.99,5.33 | U3.7 8.08,11.99 v8.38,11.68 8.38,9.65 v8,9.27
  Bottom 0.178: U6.C1 9.62,11.43 9.38,11.68 v8.38,11.68 | v8,9.27 10.16,7.11 13.21,7.11 v14.99,5.33 14.99,4.06 13.08,2.16 8.76,2.16 v8.51,1.91
SCL_1V8  (via drill 0.25)
  Top 0.178: J1.4 20.58,10.79 19.68,11.68 17.14,11.68 16.51,12.32 v13.97,12.32 | U3.2 5.38,11.99 5.08,11.68 v5.08,11.3
  Bottom 0.178: v13.97,12.32 13.97,13.72 13.21,14.48 6.1,14.48 4.83,13.21 4.83,11.56 v5.08,11.3 5.08,8.89 5.59,8.38 6.48,8.38 7.37,7.49 7.37,6.6 7.09,6.33 U1.2
SDA  (via drill 0.25)
  Top 0.178: U7.14 17.64,5.58 16.64,4.57 v14.48,4.57 | U4.37 7.73,2.73 7.49,2.5 v7.49,2.11 | U3.6 7.54,11.64 v7.75,11.43 7.75,10.54 7.24,10.03 v7.24,9.27
  Bottom 0.051: U6.B2 10.38,11.68 10.38,11.22 10.26,11.1 8.08,11.1 v7.75,11.43
  Bottom 0.178: v7.24,9.27 9.91,6.6 12.95,6.6 14.48,5.08 v14.48,4.57 14.48,4.19 12.91,2.62 8,2.62 v7.49,2.11
SDA_1V8  (via drill 0.25)
  Top 0.178: J1.3 20.44,10.29 19.43,11.3 16.89,11.3 16.38,11.81 13.59,11.81 v13.21,12.19 | U3.3 5.79,11.64 5.59,11.43 v5.59,10.92
  Bottom 0.178: v13.21,12.19 13.21,13.84 12.95,14.1 6.35,14.1 5.33,13.08 5.33,11.94 5.59,11.68 v5.59,10.92 5.59,9.14 5.84,8.89 6.73,8.89 7.87,7.75 7.87,5.95 7.45,5.53 U1.3
SWDCLK  (via drill 0.25)
  Top 0.178: U4.25 6.05,7.79 5.21,8.64 3.81,8.64 3.3,9.14 v3.3,9.78
  Bottom 0.178: J2.4 2.89,12.67 2.62,12.39 2.62,10.46 v3.3,9.78 3.3,9.02 VBUS5.P$1
SWDIO  (via drill 0.25)
  Top 0.178: U4.26 5.82,7.39 5.21,8 3.68,8 2.67,9.02 2.67,11.81 2.03,12.45 VBUS6.P$1 v0.76,12.45
  Bottom 0.178: J2.3 0.98,12.67 v0.76,12.45
TX  (via drill 0.25)
  Top 0.178: v6.22,10.29 4.32,10.29 3.81,10.79 3.81,12.06 v4.06,12.32 4.06,12.83 VBUS8.P$1
  Bottom 0.178: R15.1 10.03,10.16 6.35,10.16 v6.22,10.29 | v4.06,12.32 J2.6
VBAT  (via drill 0.25)
  Top 0.178: v23.62,1.65 23.62,2.14 24.37,2.89 S2.2
  Top 0.254: S2.2 24.26,3.39 24.26,4.57 v24.28,4.57
  Bottom 0.178: v23.62,1.65 23.62,1.14 23.24,0.76 6.1,0.76 5.97,0.89 C24.1 C25.1 5.08,2.79 4.75,3.13 U1.9 U1.10 | IC6.2 C18.1 16.26,10.16 18.03,8.38 22.8,8.38 23.06,8.13 C20.1
  Bottom 0.254: C20.1 23.87,7.49 24.28,7.09 U5.4 | U5.4 26.22,5.69 L3.P$1 27.18,7.49 25.65,9.02 23.51,9.02 22.5,10.03 21.59,10.03 20.99,10.63 IC6.6 21.57,11.16 21.84,11.43 21.84,12.19 21.57,12.46 IC6.4 | U5.4 v24.28,4.57 U5.5
VBUS  (via drill 0.3 pad 0.55)
  Top 0.254: v29.21,1.52 26.54,1.52 25.87,2.19 S2.1
  Bottom 0.178: v29.21,1.52 28.07,0.38 4.32,0.38 3.3,1.4 3.3,6.48 2.23,7.54 2.23,11.75 2.01,11.97 J2.7
  Bottom 0.254: v29.21,1.52 32,1.52 32.51,2.03 B+.P$1 29.72,3.81 28.83,4.7 28.83,7.37 26.67,9.53 24,9.53 23.37,10.16 R3.2
VCOMH
  Top 0.178: C19.1 27.09,5.74 J9.6
XC1
  Top 0.178: U4.34 6.23,4.19 5.46,4.95 C11.2 4.33,4.94 Y2.3
XC2
  Top 0.178: U4.35 6.84,3.79 6.35,3.3 6.35,2.67 6.06,2.37 Y2.1 C16.2

### Text on the board
tPlace: 3V3 | TX | TMS | RX | U2
bPlace: GND | OUT+ | OUT- | TCK